# Altium schematic sheet OCL_15W.SchDoc
size A; SheetNumber: 1; SheetTotal: 1
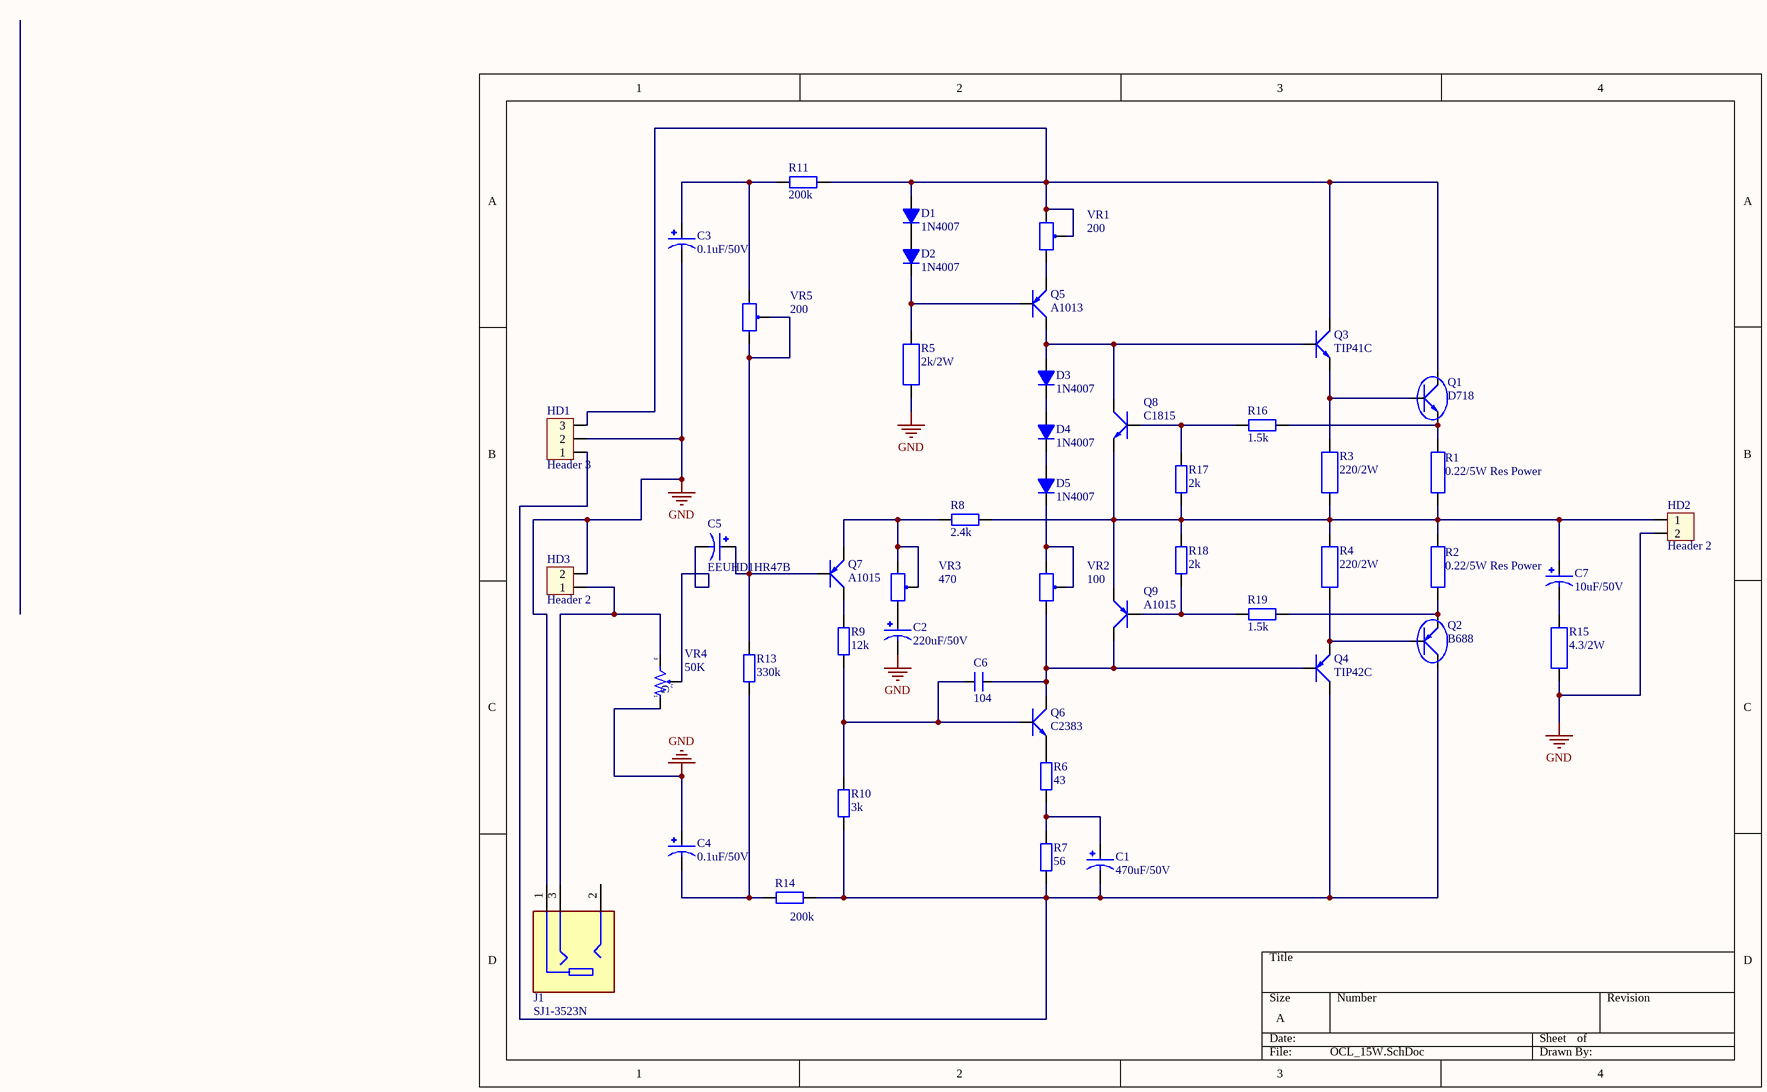
[diagram p0: OCL_15W.SchDoc]

## Parts
C1  470uF/50V  [CAPPRD500W60D1250H2000]
C2  220uF/50V  [CAPPRD500W60D800H2000]
C3  0.1uF/50V  [CAPPRD500W50D500H1100]
C4  0.1uF/50V  [CAPPRD500W50D500H1100]
C5  EEUHD1HR47B  [CAPPRD500W50D500H1100]
C6  104  [CN2]
C7  10uF/50V  [CAPPRD250W50D630H1120]
D1  1N4007  [D2A]
D2  1N4007  [D2A]
D3  1N4007  [D2A]
D4  1N4007  [D2A]
D5  1N4007  [D2A]
HD1  Header 3  [HED3]
HD2  Header 2  [HED2]
HD3  Header 2  [HED2]
J1  SJ1-3523N  [CUI_SJ1-3523N]
Q1  D718  [QTO-247]
Q2  B688  [QTO-247]
Q3  TIP41C  [QTO-220]
Q4  TIP42C  [QTO-220]
Q5  A1013  [QTO-92]
Q6  C2383  [QTO-92]
Q7  A1015  [QTO-92]
Q8  C1815  [QTO-92]
Q9  A1015  [QTO-92]
R1  0.22/5W Res Power  [DIEN TRO 5W]
R2  0.22/5W Res Power  [DIEN TRO 5W]
R3  220/2W  [R2W]
R4  220/2W  [R2W]
R5  2k/2W  [R2W]
R6  43  [R1/4W]
R7  56  [R1/4W]
R8  2.4k  [R1/4W]
R9  12k  [R1/4W]
R10  3k  [R1/4W]
R11  200k  [R1/4W]
R13  330k  [R1/4W]
R14  200k  [R1/4W]
R15  4.3/2W  [R2W]
R16  1.5k  [R1/4W]
R17  2k  [R1/4W]
R18  2k  [R1/4W]
R19  1.5k  [R1/4W]
VR1  200  [VR1]
VR2  100  [VR1]
VR3  470  [VR1]
VR4  50K  [VR-S1]
VR5  200  [VR1]

## Nets
GND: C2.N C3.N C4.P HD1.2 HD2.2 HD3.2 J1.1 R5.1 R15.1 VR4.1
NetC1_N: C1.N HD1.1 Q2.2(C) Q4.2(C) R7.1 R10.1 R14.1
NetC1_P: C1.P R6.1 R7.2
NetC2_P: C2.P VR3.3
NetC3_P: C3.P R11.2 VR5.1
NetC4_N: C4.N R13.1 R14.2
NetC5_N: C5.N VR4.2
NetC5_P: C5.P Q7.3(B) R13.2 VR5.2 VR5.3
NetC6_1: C6.1 Q6.3(B) R9.1 R10.2
NetC6_2: C6.2 Q4.1(B) Q6.2(C) Q9.2(C) VR2.3
NetC7_N: C7.N R15.2
NetC7_P: C7.P HD2.1 Q8.1(E) Q9.1(E) R1.1 R2.2 R3.1 R4.2 R8.1 R17.1 R18.2
NetD1_1: D1.1(A) HD1.3 Q1.2(C) Q3.2(C) R11.1 VR1.1 VR1.2
NetD1_2: D1.2(K) D2.1(A)
NetD2_2: D2.2(K) Q5.3(B) R5.2
NetD3_1: D3.1(A) Q3.1(B) Q5.2(C) Q8.2(C)
NetD3_2: D3.2(K) D4.1(A)
NetD4_2: D4.2(K) D5.1(A)
NetD5_2: D5.2(K) VR2.1 VR2.2
NetHD3_1: HD3.1 J1.3 VR4.3
NetQ1_1: Q1.1(B) Q3.3(E) R3.2
NetQ1_3: Q1.3(E) R1.2 R16.1
NetQ2_1: Q2.1(B) Q4.3(E) R4.1
NetQ2_3: Q2.3(E) R2.1 R19.1
NetQ5_1: Q5.1(E) VR1.3
NetQ6_1: Q6.1(E) R6.2
NetQ7_1: Q7.1(E) R8.2 VR3.1 VR3.2
NetQ7_2: Q7.2(C) R9.2
NetQ8_3: Q8.3(B) R16.2 R17.2
NetQ9_3: Q9.3(B) R18.1 R19.2

Not connected (* = marked no-connect by the designer): J1 2

## Notes on the sheet
- (in symbol VR-S) G

## Library data of the parts
C1 = EEUEB1H471B: Cap Aluminum 470uF 50V 20% (12.5 X 20mm) Radial 5mm 370mA 10000 hr 105C Ammo Pack; MF: Panasonic; MP: EEU-EB1H471B; Value: *; Check_prices: https://www.snapeda.com/parts/EEU-EB1H471B/Panasonic/view-part/?ref=eda; Purchase-URL: https://pricing.snapeda.com/search/part/EEU-EB1H471B/?ref=eda; Price: None; SnapEDA_Link: https://www.snapeda.com/parts/EEU-EB1H471B/Panasonic/view-part/?ref=snap; Availability: In Stock; Package: RADIAL-2 Panasonic
C2 = EEUFS1H221LB: CAP ALUM 220UF 20% 50V RADIAL; MP: EEU-FS1H221LB; MF: Panasonic Electronic Components; Check_prices: https://www.snapeda.com/parts/EEU-FS1H221LB/Panasonic/view-part/6222710/?ref=eda; Package: RADIAL-2 Panasonic; Price: None; Availability: In Stock; Purchase-URL: https://pricing.snapeda.com/search/part/EEU-FS1H221LB/?ref=eda; SnapEDA_Link: https://www.snapeda.com/parts/EEU-FS1H221LB/Panasonic/view-part/6222710/?ref=snap; Value: *
C3-C5 = EEUHD1HR47B: CAP ALUM 0.47UF 20% 50V RADIAL; MF: Panasonic; SnapEDA_Link: https://www.snapeda.com/parts/EEUHD1HR47B/Panasonic/view-part/?ref=snap; Package: RADIAL-2 Panasonic; Value: *; MP: EEUHD1HR47B; Check_prices: https://www.snapeda.com/parts/EEUHD1HR47B/Panasonic/view-part/?ref=eda
C6 = CN2: Cap np 104 => 105pF; Value: 0.1uF
C7 = ECEA1HN100UI: CAP ALUM 10UF 20% 50V RADIAL; MP: ECE-A1HN100UI; MF: Panasonic; SnapEDA_Link: https://www.snapeda.com/parts/ECE-A1HN100UI/Panasonic/view-part/2321690/?ref=snap; Price: None; Check_prices: https://www.snapeda.com/parts/ECE-A1HN100UI/Panasonic/view-part/2321690/?ref=eda; Value: *; Availability: In Stock; Package: RADIAL-2 Panasonic
D1-D5 = D1A: Diode 1A; Value: 1N4007
HD1 = Hed3: Header 3 (Green); Value: Header 3
HD2 HD3 = Hed2: Header 2 (Green); Value: Header 2
J1 = SJ1-3523N: 3.5 mm, Stereo, Right Angle, Through Hole, 3 Conductors, 0 Internal Switches, Audio Jack Connector; MF: Same Sky; SnapEDA_Link: https://www.snapeda.com/parts/SJ1-3523N/Same+Sky/view-part/?ref=snap; Package: None; Value: *; MP: SJ1-3523N; Check_prices: https://www.snapeda.com/parts/SJ1-3523N/Same+Sky/view-part/?ref=eda
Q1 = D718: Transistor Power Supply; Value: D718
Q2 = B688: Transistor Power Supply; Value: B688
Q3 = TIP41C: NPN 2W, BCE; Value: TIP41C
Q4 = TIP42C: PNP 2W, BCE; Value: TIP42C
Q5 = PNP_ECB: P 600mW, ECB; Value: A1015
Q6 = NPN_ECB: P 600mW, ECB; Value: C1815
Q7 Q9 = A1015: PNP 600mW, ECB; Value: A1015
Q8 = C1815: NPN 600mW, ECB; Value: C1815
R1 R2 = Res 5W: 5W Res Power; Creator: Nguyen Ba Bien
R3-R5 R15 = R2W: Resistor 2W; Value: R2W - 47
R6-R11 R13 R14 R16-R19 = R1/4W: Resistor 1/4W; Value: R1/4W - 1K
VR1-VR3 VR5 = VR: Var Resistor; Value: VR 10K
VR4 = VR-S: Var Resistor; Value: Volume 50k